# Altium schematic sheet MCU_Power.SchDoc: MCU - Power, SMPS, Clock, Reset, Boot
size A3; ApprovedBy: Weymen Koo; CheckedBy: -; DrawnBy: Weymen Koo; DocumentNumber: UBCAD-FCSOM-SCH; Revision: A; SheetNumber: 4; SheetTotal: 18; ProjectTitle: Flight Controller SoM; Status: PRELIMINARY; ReleaseDate: 2026-11-14
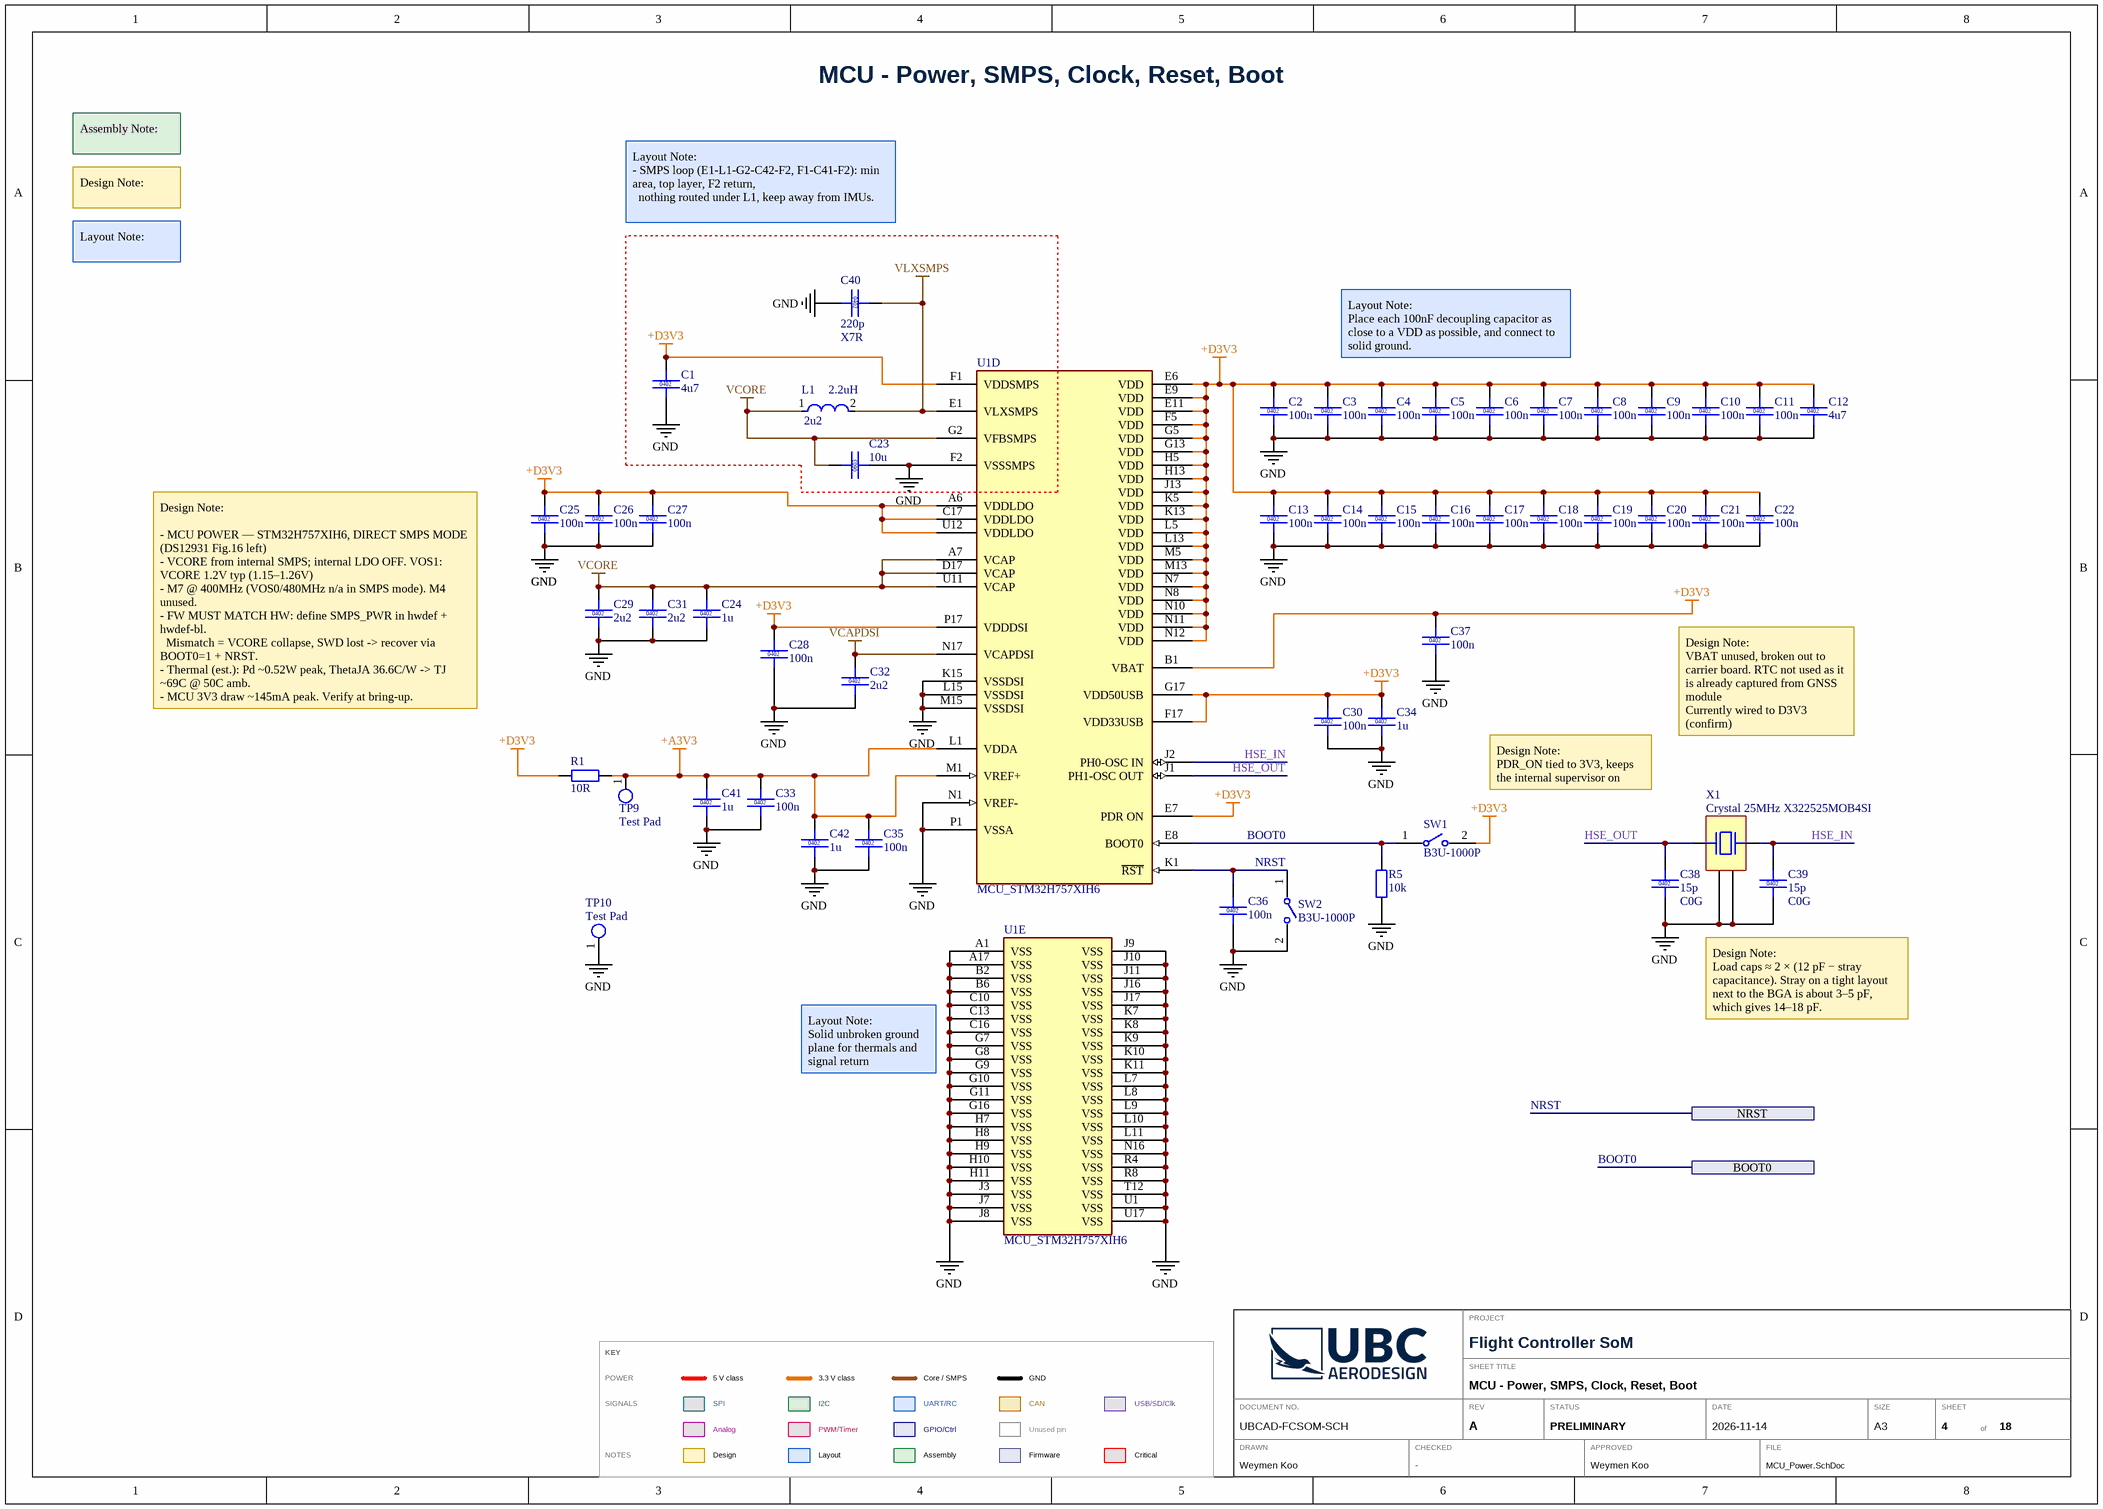
[diagram p0: MCU_Power.SchDoc]

## Parts
C1  4u7  [CAPC1005X05N]
C2  100n  [CAPC1005X05N]
C3  100n  [CAPC1005X05N]
C4  100n  [CAPC1005X05N]
C5  100n  [CAPC1005X05N]
C6  100n  [CAPC1005X05N]
C7  100n  [CAPC1005X05N]
C8  100n  [CAPC1005X05N]
C9  100n  [CAPC1005X05N]
C10  100n  [CAPC1005X05N]
C11  100n  [CAPC1005X05N]
C12  4u7  [CAPC1005X05N]
C13  100n  [CAPC1005X05N]
C14  100n  [CAPC1005X05N]
C15  100n  [CAPC1005X05N]
C16  100n  [CAPC1005X05N]
C17  100n  [CAPC1005X05N]
C18  100n  [CAPC1005X05N]
C19  100n  [CAPC1005X05N]
C20  100n  [CAPC1005X05N]
C21  100n  [CAPC1005X05N]
C22  100n  [CAPC1005X05N]
C23  10u  [CAPC1608X08N]
C24  1u  [CAPC1005X05N]
C25  100n  [CAPC1005X05N]
C26  100n  [CAPC1005X05N]
C27  100n  [CAPC1005X05N]
C28  100n  [CAPC1005X05N]
C29  2u2  [CAPC1005X05N]
C30  100n  [CAPC1005X05N]
C31  2u2  [CAPC1005X05N]
C32  2u2  [CAPC1005X05N]
C33  100n  [CAPC1005X05N]
C34  1u  [CAPC1005X05N]
C35  100n  [CAPC1005X05N]
C36  100n  [CAPC1005X05N]
C37  100n  [CAPC1005X05N]
C38  15p  Temperature Coefficient: C0G  [CAPC1005X05N]
C39  15p  Temperature Coefficient: C0G  [CAPC1005X05N]
C40  220p  Temperature Coefficient: X7R  [CAPC1005X05N]
C41  1u  [CAPC1005X05N]
C42  1u  [CAPC1005X05N]
L1  2u2  Inductance: 2.2uH  [FP-DFE252012C-IPC_B]
R1  10R  [IPC C R0402 NO SILK]
R5  10k  [IPC C R0402 NO SILK]
SW1  B3U-1000P  [FP-B3U-1000P-MFG]
SW2  B3U-1000P  [FP-B3U-1000P-MFG]
TP9  Test Pad  [PCBComponent_1]
TP10  Test Pad  [PCBComponent_1]
U1  MCU_STM32H757XIH6  [FP-TFBGA2650-A07U-MFG]  (parts D,E of 5)
X1  Crystal 25MHz X322525MOB4SI  [OSC-SMD_4P-L3.2-W2.5-BL]

## Ports
BOOT0 (see 1[3A], 18[5A]), NRST (see 1[3A], 16[6C], 18[5A])

## Nets
+A3V3: C33.1 C35.1 C41.1 C42.1 R1.1 TP9.1 U1.L1(VDDA) U1.M1(VREF+)
+D3V3: C1.1 C2.1 C3.1 C4.1 C5.1 C6.1 C7.1 C8.1 C9.1 C10.1 C11.1 C12.1 C13.1 C14.1 C15.1 C16.1 C17.1 C18.1 C19.1 C20.1 C21.1 C22.1 C25.1 C26.1 C27.1 C28.1 C30.1 C34.1 C37.1 R1.2 SW1.2 U1.A6(VDDLDO) U1.B1(VBAT) U1.C17(VDDLDO) U1.E6(VDD) U1.E7(PDR_ON) U1.E9(VDD) U1.E11(VDD) U1.F1(VDDSMPS) U1.F5(VDD) U1.F17(VDD33USB) U1.G5(VDD) U1.G13(VDD) U1.G17(VDD50USB) U1.H5(VDD) U1.H13(VDD) U1.J13(VDD) U1.K5(VDD) U1.K13(VDD) U1.L5(VDD) U1.L13(VDD) U1.M5(VDD) U1.M13(VDD) U1.N7(VDD) U1.N8(VDD) U1.N10(VDD) U1.N11(VDD) U1.N12(VDD) U1.P17(VDDDSI) U1.U12(VDDLDO)
GND: C1.2 C2.2 C3.2 C4.2 C5.2 C6.2 C7.2 C8.2 C9.2 C10.2 C11.2 C12.2 C13.2 C14.2 C15.2 C16.2 C17.2 C18.2 C19.2 C20.2 C21.2 C22.2 C23.2 C24.2 C25.2 C26.2 C27.2 C28.2 C29.2 C30.2 C31.2 C32.2 C33.2 C34.2 C35.2 C36.2 C37.2 C38.2 C39.2 C40.1 C41.2 C42.2 R5.1 SW2.2 TP10.1 U1.A1(VSS) U1.A17(VSS) U1.B2(VSS) U1.B6(VSS) U1.C10(VSS) U1.C13(VSS) U1.C16(VSS) U1.F2(VSSSMPS) U1.G7(VSS) U1.G8(VSS) U1.G9(VSS) U1.G10(VSS) U1.G11(VSS) U1.G16(VSS) U1.H7(VSS) U1.H8(VSS) U1.H9(VSS) U1.H10(VSS) U1.H11(VSS) U1.J3(VSS) U1.J7(VSS) U1.J8(VSS) U1.J9(VSS) U1.J10(VSS) U1.J11(VSS) U1.J16(VSS) U1.J17(VSS) U1.K7(VSS) U1.K8(VSS) U1.K9(VSS) U1.K10(VSS) U1.K11(VSS) U1.K15(VSSDSI) U1.L7(VSS) U1.L8(VSS) U1.L9(VSS) U1.L10(VSS) U1.L11(VSS) U1.L15(VSSDSI) U1.M15(VSSDSI) U1.N1(VREF-) U1.N16(VSS) U1.P1(VSSA) U1.R4(VSS) U1.R8(VSS) U1.T12(VSS) U1.U1(VSS) U1.U17(VSS) X1.2 X1.4
VCAPDSI: C32.1 U1.N17(VCAPDSI)
VCORE: C23.1 C24.1 C29.1 C31.1 L1.1 U1.A7(VCAP) U1.D17(VCAP) U1.G2(VFBSMPS) U1.U11(VCAP)
VLXSMPS: C40.2 L1.2 U1.E1(VLXSMPS)
BOOT0: R5.2 SW1.1 U1.E8(BOOT0) ; port BOOT0
HSE_IN: C39.1 U1.J2(PH0-OSC_IN) X1.3
HSE_OUT: C38.1 U1.J1(PH1-OSC_OUT) X1.1
NRST: C36.1 SW2.1 U1.K1(~{RST}) ; port NRST

## Notes on the sheet
- Assembly Note:
- Design Note:
- Layout Note:
  - SMPS loop (E1-L1-G2-C42-F2, F1-C41-F2): min area, top layer, F2 return,
  nothing routed under L1, keep away from IMUs.
- Layout Note:
- Layout Note:
  Place each 100nF decoupling capacitor as close to a VDD as possible, and connect to solid ground.
- Design Note:
  - MCU POWER — STM32H757XIH6, DIRECT SMPS MODE (DS12931 Fig.16 left)
  - VCORE from internal SMPS; internal LDO OFF. VOS1: VCORE 1.2V typ (1.15–1.26V)
  - M7 @ 400MHz (VOS0/480MHz n/a in SMPS mode). M4 unused.
  - FW MUST MATCH HW: define SMPS_PWR in hwdef + hwdef-bl.
  Mismatch = VCORE collapse, SWD lost -> recover via BOOT0=1 + NRST.
  - Thermal (est.): Pd ~0.52W peak, ThetaJA 36.6C/W -> TJ ~69C @ 50C amb.
  - MCU 3V3 draw ~145mA peak. Verify at bring-up.
- Design Note:
  PDR_ON tied to 3V3, keeps the internal supervisor on
- Design Note:
  VBAT unused, broken out to carrier board. RTC not used as it is already captured from GNSS module
  Currently wired to D3V3 (confirm)
- Design Note:
  Load caps ≈ 2 × (12 pF − stray capacitance). Stray on a tight layout next to the BGA is about 3–5 pF, which gives 14–18 pF.
- Layout Note:
  Solid unbroken ground plane for thermals and signal return
- PROJECT
- KEY
- POWER
- 5 V class
- 3.3 V class
- Core / SMPS
- GND
- SHEET TITLE
- SIGNALS
- NOTES
- SPI
- Analog
- Design
- I2C
- PWM/Timer
- Layout
- UART/RC
- GPIO/Ctrl
- Assembly
- CAN
- Unused pin
- Firmware
- USB/SD/Clk
- Critical
- DRAWN
- DOCUMENT NO.
- CHECKED
- REV
- STATUS
- APPROVED
- DATE
- FILE
- SIZE
- A3
- SHEET
- of

## Library data of the parts
C1 C12 = CMP-002-000094-5: CAP 4u7 10V X5R 20% 0402; Manufacturer: Samsung; Manufacturer Part Number: CL05A475MP5NRNC; Value: 4u7; Tolerance: 20%; Package: 0402; Voltage: 10V; Dielectric: X5R; LCSC Part #: C23733
C2-C11 C13-C22 C25-C28 C30 C33 C35-C37 = CMP-002-000094-5: CAP 100n 16V X7R 10% 0402; Manufacturer: Samsung; Manufacturer Part Number: CL05B104KO5NNNC; Value: 100n; Tolerance: 10%; Package: 0402; Voltage: 16V; Dielectric: X7R; LCSC Part #: C1525
C23 = CMP-002-000095-4: CAP 10u 10V X5R 10% 0603; Manufacturer: Samsung; Manufacturer Part Number: CL10A106KP8NNNC; Value: 10u; Tolerance: 10%; Package: 0603; Voltage: 10V; Dielectric: X5R; LCSC Part #: C19702
C24 C34 C41 C42 = CMP-002-000094-5: CAP 1u 25V X5R 10% 0402; Manufacturer: Samsung; Manufacturer Part Number: CL05A105KA5NQNC; Value: 1u; Tolerance: 10%; Package: 0402; Voltage: 25V; Dielectric: X5R; LCSC Part #: C52923
C29 C31 C32 = CMP-002-000094-5: CAP 2u2 6.3V X5R 20% 0402; Manufacturer: Samsung; Manufacturer Part Number: CL05A225MQ5NSNC; Value: 2u2; Tolerance: 20%; Package: 0402; Voltage: 6.3V; Dielectric: X5R; LCSC Part #: C12530
C38 C39 = CMP-002-000094-5: CAP 15p 50V C0G 5% 0402; Manufacturer: FH; Manufacturer Part Number: 0402CG150J500NT; Value: 15p; Tolerance: 5%; Package: 0402; Voltage: 50V; Dielectric: C0G; LCSC Part #: C1548
C40 = CMP-002-000094-5: CAP 220p 50V X7R 10% 0402; Manufacturer: FH; Manufacturer Part Number: 0402B221K500NT; Value: 220p; Tolerance: 10%; Package: 0402; Voltage: 50V; Dielectric: X7R; LCSC Part #: C1530
L1 = CMP-06042-014676-1: Shielded Wirewound Inductor 2.2uH 20% 2300mA 0.082Ω 1008 (2520); Manufacturer: Murata; Manufacturer Part Number: DFE252012F-2R2M=P2; DC Resistance (DCR): 82mR; Test Frequency: 1MHz; Saturation Current: 3.6A; Core Material: Ferrite; Current Rating: 2.3A; Case/Package: 1008; Tolerance: 20%; Max Operating Temperature: 125°C; Shielding: Shielded; Height - Seated (Max): 0.047inch; Packaging: Tape and Reel; Min Operating Temperature: -40°C; Length: 0.098inch; Width: 0.079inch; Case Code (Imperial): 1008; Mount: Surface Mount; Case Code (Metric): 2520; Value: 2u2; Package: 2520
R1 = CMP-008-000000-2: RES 10R 1% 1/16W 0402; Manufacturer: UNI-ROYAL; Manufacturer Part Number: 0402WGF100JTCE; Value: 10R; Source: Schlib1.SchLib; Design Item ID: Generic RES 0402; Package: 0402; Tolerance: 1%; Power: 1/16W; LCSC Part #: C25077
R5 = CMP-008-000000-2: RES 10k 1% 1/16W 0402; Manufacturer: UNI-ROYAL; Manufacturer Part Number: 0402WGF1002TCE; Value: 10k; Source: Schlib1.SchLib; Design Item ID: Generic RES 0402; Package: 0402; Tolerance: 1%; Power: 1/16W; LCSC Part #: C25744
SW1 SW2 = CMP-2100-03586-2: SWITCH TACTILE SPST-NO 0.05A 12V; Contact Resistance: 100mR; Operating Force: 1.5N; Max Current Rating: 50mA; Switch Travel: 0.15mm; Actuator Type: Standard; Mechanical Life: 200000Cycles; Ratings: Dust Proof; Illumination Type: Non-Illuminated; Throw Configuration: SPST; Actuator Length: 0.4mm; Switch Function: Off-Mom; Height: 1.2mm; Width: 3mm; Weight: 0.000776oz; Contact Material: Silver; Max Voltage Rating (DC): 12V; Insulation Resistance: 100MR; Lead Free: Lead Free; Current Rating: 50mA; Termination: SMD/SMT; Length: 4mm; Voltage Rating (DC): 12V; Contact Current Rating: 50mA; Orientation: Straight; Depth: 2.5mm; Max Operating Temperature: 70°C; Packaging: Tape and Reel; Min Operating Temperature: -25°C; Package Quantity: 1; Mount: Surface Mount; Electrical Life: 200000Cycles
TP9 TP10 = CMP-092-000000-4: Design Item ID: TP; Source: Testpoint.SchLib
U1 = CMP-029-000010-1: MCU 32-bit ARM Cortex M7/M4 RISC 2MB Flash 3.3V 265-Pin TFBGA Tray; Component Type: Standard; Design Item ID: MCU_STM32H757XIH6; Pin Count: 265; Source: CRLS Lib.SchLib
X1 = CMP-004-000000-2: Crystal, 25 MHz, 10 ppm, 3225; Manufacturer: YXC(扬兴晶振); Add into BOM: yes; Frequency Tolerance: ±10ppm; Crystal Type: SMD Crystal Resonator; Frequency Stability: ±30ppm; Value: 25MHz; Supplier Part: C9006; Manufacturer Part: X322525MOB4SI; Design Item ID: Crystal 25MHz X322525MOB4SI; Supplier Footprint: SMD3225-4P; Device: X322525MOB4SI; LCSC Part Name: 25MHz ±10ppm 12pF; Symbol: X322525MOB4SI; Source: Schlib1.SchLib; Datasheet: https://atta.szlcsc.com/upload/public/pdf/source/20210329/C112971_1F611BDC486E193C1706F6D8EB5AA189.pdf; Convert to PCB: yes; JLCPCB Part Class: Basic Part